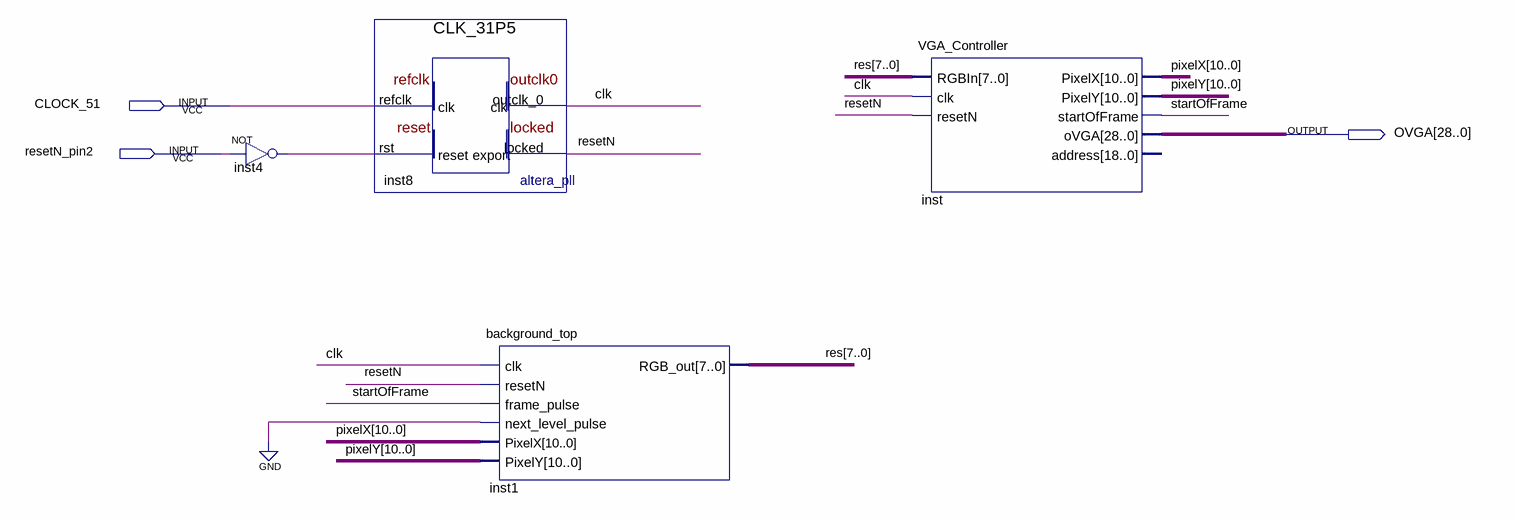
[diagram p0: schematic sheet]
// Quartus schematic BG_test.bdf as structural Verilog: 4 symbols, 3 pins
module BG_test (
  input  CLOCK_51,
  input  resetN_pin2,
  output [28:0] OVGA
);

  wire clk, inst4_out, resetN, startOfFrame;
  wire [7:0] res;
  wire [10:0] pixelX, pixelY;

  not inst4 (inst4_out, resetN_pin2);
  CLK_31P5 inst8 (.refclk(CLOCK_51), .rst(inst4_out), .outclk_0(clk), .locked(resetN));
  background_top inst1 (
    .clk(clk), .resetN(resetN), .frame_pulse(startOfFrame), .next_level_pulse(1'b0), .PixelX(pixelX),
    .PixelY(pixelY), .RGB_out(res));
  VGA_Controller inst (
    .RGBIn(res), .clk(clk), .resetN(resetN), .PixelX(pixelX), .PixelY(pixelY), .startOfFrame(startOfFrame),
    .oVGA(OVGA));  // open: address
endmodule
